# Altium schematic sheet CH32L103-WUI-R1-1v2.SchDoc
size 274 x 287 mm; Symbol: Sheet-Symbol_A4; Company: Caesar; Drawed: Caesar; Reviewed: Caesar; Version: V1.0; Page Size: A4; @Project Name: CH32X035G8U6_Multifunctional_Keyboard-1v3-20240412; @Page Count: 1; @Update Date: 2024-04-12; @Create Date: 2024-03-18; @Schematic Name: Schematic1; @Page No: 1; @Page Name: P1; Device: Sheet-Symbol_A4; SheetNumber: 1; SheetTotal: 1
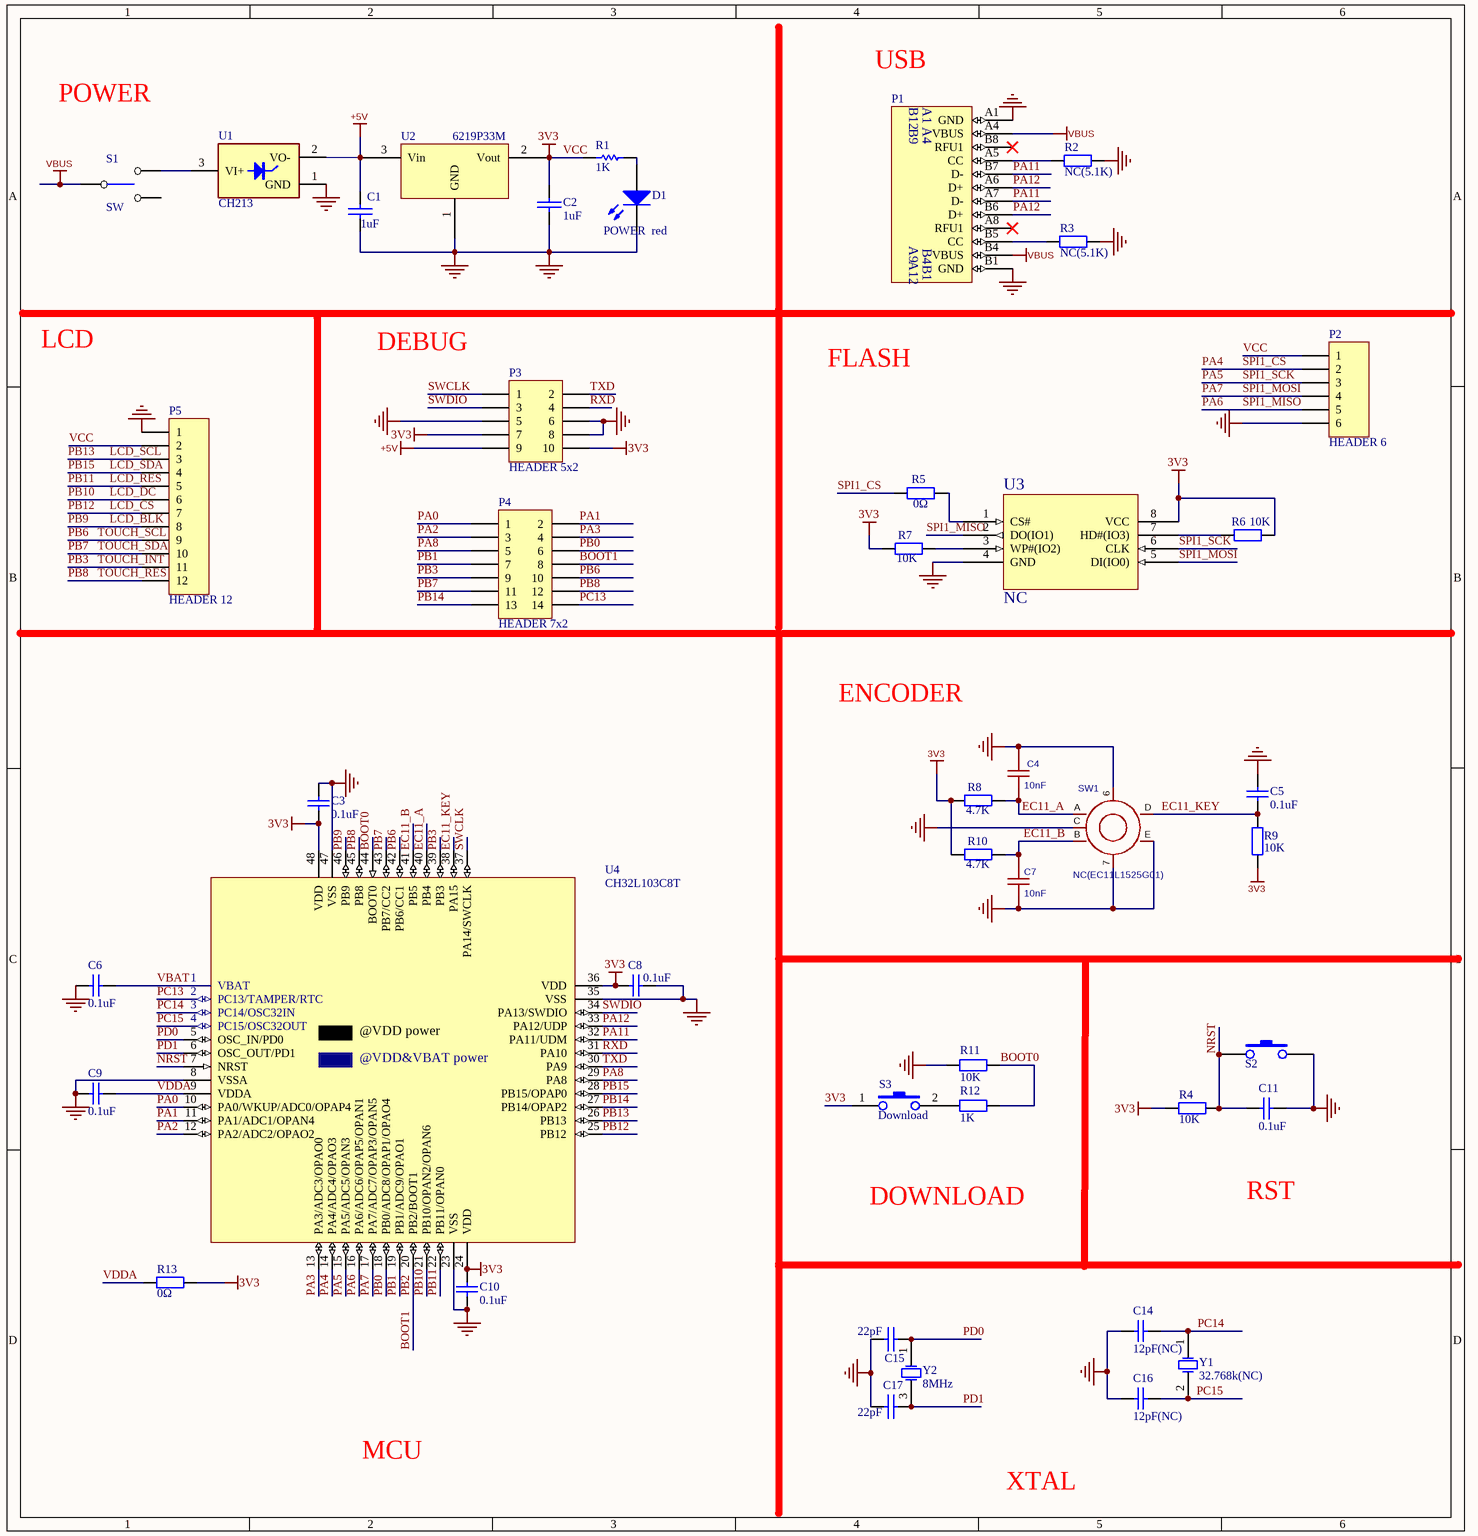
[diagram p0: CH32L103-WUI-R1-1v2.SchDoc]

## Parts
C1  1uF  [0402_C]
C2  1uF  [0402_C]
C3  0.1uF  [0402_C]
C4  10nF  [0402_C]
C5  0.1uF  [0402_C]
C6  0.1uF  [0402_C]
C7  10nF  [0402_C]
C8  0.1uF  [0402_C]
C9  0.1uF  [0402_C]
C10  0.1uF  [0402_C]
C11  0.1uF  [0402_C]
C14  12pF(NC)  [0402_C]
C15  22pF  [0402_C]
C16  12pF(NC)  [0402_C]
C17  22pF  [0402_C]
D1  POWER  red  [0603+]
P1  TYPE-C  [TYPE-C-Receptacle-2.0]  (value not drawn)
P2  HEADER 6  [SIP6-2.54mm]
P3  HEADER 5x2  [IDC10-2.54mm]
P4  HEADER 7x2  [IDC14-2.54mm]
P5  HEADER 12  [SIP12-2.54mm]
R1  1K  [0402]
R2  NC(5.1K)  [0402]
R3  NC(5.1K)  [0402]
R4  10K  [0402]
R5  0Ω  [0402]
R6  10K  [0402]
R7  10K  [0402]
R8  4.7K  [0402]
R9  10K  [0402]
R10  4.7K  [0402]
R11  10K  [0402]
R12  1K  [0402]
R13  0Ω  [0402]
S1  SW  [SW1]
S2  NRST  [贴片按键]  (value not drawn)
S3  Download  [贴片按键]
SW1  NC(EC11L1525G01)  [SW-TH_ALPS_EC11L1525G01]
U1  CH213  [SOT-23-3]
U2  6219P33M  [SOT-23]
U3  NC  [SOIC-8_208mil]
U4  CH32L103C8T  [LQFP48]
Y1  32.768k(NC)  [FC-135]
Y2  8MHz  [XT3225]

## Nets
3V3: C2.1 C3.2 C8.2 C10.2 P2.1 P3.7 P3.10 P5.2 R1.2 R4.2 R6.2 R7.1 R8.1 R9.1 R10.1 R13.1 S3.1 U2.2(Vout) U3.8(VCC) U4.24(VDD) U4.36(VDD) U4.48(VDD)  [also labelled VCC]
+5V: C1.1 P3.9 U1.2(VO-) U2.3(Vin)
GND: C1.2 C2.2 C3.1 C4.2 C5.1 C6.2 C7.2 C8.1 C9.2 C10.1 C11.1 C14.2 C15.1 C16.2 C17.1 D1.2(K) P1.A1(GND) P1.B1(GND) P2.6 P3.5 P3.6 P3.8 P5.1 R2.2 R3.2 R11.2 S2.2 SW1.6(EH) SW1.7(EH) SW1.C SW1.E U1.1(GND) U2.1(GND) U3.4(GND) U4.8(VSSA) U4.23(VSS) U4.35(VSS) U4.47(VSS)
VBUS: P1.A4(VBUS) P1.B4(VBUS) S1.1
BOOT0: R11.1 R12.1 U4.44(BOOT0)
BOOT1: P4.8 U4.20(PB2/BOOT1)  [also labelled PB2]
EC11_A: C4.1 R8.2 SW1.A U4.40(PB4)
EC11_B: C7.1 R10.2 SW1.B U4.41(PB5)
EC11_KEY: C5.2 R9.2 SW1.D U4.38(PA15)
LCD_BLK: P5.8 U4.46(PB9)  [also labelled PB9]
LCD_CS: P5.7 U4.25(PB12)  [also labelled PB12]
LCD_DC: P5.6 U4.21(PB10/OPAN2/OPAN6)  [also labelled PB10]
LCD_RES: P5.5 U4.22(PB11/OPAN0)  [also labelled PB11]
LCD_SCL: P5.3 U4.26(PB13)  [also labelled PB13]
LCD_SDA: P5.4 U4.28(PB15/OPAP0)  [also labelled PB15]
NRST: C11.2 R4.1 S2.1 U4.7(NRST)
PA0: P4.1 U4.10(PA0/WKUP/ADC0/OPAP4)
PA1: P4.2 U4.11(PA1/ADC1/OPAN4)
PA2: P4.3 U4.12(PA2/ADC2/OPAO2)
PA3: P4.4 U4.13(PA3/ADC3/OPAO0)
PA4: P2.2 R5.1 U4.14(PA4/ADC4/OPAO3)  [also labelled SPI1_CS]
PA5: P2.3 U3.6(CLK) U4.15(PA5/ADC5/OPAN3)  [also labelled SPI1_SCK]
PA6: P2.5 U3.2(DO(IO1)) U4.16(PA6/ADC6/OPAP5/OPAN1)  [also labelled SPI1_MISO]
PA7: P2.4 U3.5(DI(IO0)) U4.17(PA7/ADC7/OPAP3/OPAN5)  [also labelled SPI1_MOSI]
PA8: P4.5 U4.29(PA8)
PA11: P1.A7(D-) P1.B7(D-) U4.32(PA11/UDM)
PA12: P1.A6(D+) P1.B6(D+) U4.33(PA12/UDP)
PB0: P4.6 U4.18(PB0/ADC8/OPAP1/OPAO4)
PB1: P4.7 U4.19(PB1/ADC9/OPAO1)
PB3: P4.9 P5.11 U4.39(PB3)  [also labelled TOUCH_INT]
PB6: P4.10 P5.9 U4.42(PB6/CC1)  [also labelled TOUCH_SCL]
PB7: P4.11 P5.10 U4.43(PB7/CC2)  [also labelled TOUCH_SDA]
PB8: P4.12 P5.12 U4.45(PB8)  [also labelled TOUCH_RES]
PB14: P4.13 U4.27(PB14/OPAP2)
PC13: P4.14 U4.2(PC13/TAMPER/RTC)
PC14: C14.1 U4.3(PC14/OSC32IN) Y1.1(OSC1)
PC15: C16.1 U4.4(PC15/OSC32OUT) Y1.2(OSC2)
PD0: C15.2 U4.5(OSC_IN/PD0) Y2.1(OSC1)
PD1: C17.2 U4.6(OSC_OUT/PD1) Y2.3(OSC2)
RXD: P3.4 U4.31(PA10)
SWCLK: P3.1 U4.37(PA14/SWCLK)
SWDIO: P3.3 U4.34(PA13/SWDIO)
TXD: P3.2 U4.30(PA9)
VBAT: C6.1 U4.1(VBAT)
VDDA: C9.1 R13.2 U4.9(VDDA)
NetD1_1: D1.1(A) R1.1
NetP1_A5: P1.A5(CC) R2.1
NetP1_B5: P1.B5(CC) R3.1
NetR5_2: R5.2 U3.1(CS#)
NetR6_1: R6.1 U3.7(HD#(IO3))
NetR7_2: R7.2 U3.3(WP#(IO2))
NetR12_2: R12.2 S3.2
NetS1_3: S1.3 U1.3(VI+)

Not connected (* = marked no-connect by the designer): P1 A8(RFU1)* B8(RFU1)*; S1 2

## Notes on the sheet
- USB
- POWER
- LCD
- DEBUG
- FLASH
- ENCODER
- DOWNLOAD
- RST
- MCU
- XTAL
- 更新日期
- 2024-04-12
- 原理图
- 图页
- Schematic1
- P1
- 创建日期
- 物料编码
- 2024-03-18
- 审阅
- 绘制
- Caesar
- CH32X035G8U6_Multifunctional_Keyboard-1v3-20240412
- 版本
- V1.0
- 尺寸
- A4
- 页
- 1
- 共
- (in symbol CH32L103C8T) @VDD power; @VDD&VBAT power
- (in symbol TYPE-C1) B12; B9; A9; A12

## Library data of the parts
C1 C2 C15 C17 = CAP: Capacitor
C3 C5 C6 C8-C11 C14 C16 = Cap: Capacitor; Published: 8-Jun-2000; LatestRevisionDate: 17-Jul-2002; LatestRevisionNote: Re-released for DXP Platform.; PackageReference: RAD-0.3; Publisher: Altium Limited
  C5 C11: Value: 0.1uF
C4 C7 = CAP_0603: ConvertToPcb: yes; SymbolName: CapAcitance; ModelId: ac125912035d415993ca9572d50418b1; ModelName: C0603_L1.6-W0.8-H0.8; ModelTransform: 62.992,31.496,0,0,0,0,0,0,0; Value: 10nF; Device: CAP_0603; AddInBom: yes; Supplier Footprint: 0603; FootprintName: C0603
D1 = LED0: Typical INFRARED GaAs LED; Published: 8-Jun-2000; LatestRevisionDate: 08-Jul-2005; LatestRevisionNote: Mech Layer 1 removed.; PackageReference: LED-0; Publisher: Altium Limited
P1 = TYPE-C1
P2 = HEADER 6: Header, 6-Pin
P3 = HEADER 5x2: Header, 5-Pin, Dual row
P4 = HEADER 7x2: Header, 7-Pin, Dual row
P5 = HEADER 12: Header, 12-Pin
R1 = Res Semi: Semiconductor Resistor; Published: 8-Jun-2000; LatestRevisionDate: 17-Jul-2002; LatestRevisionNote: Re-released for DXP Platform.; PackageReference: AXIAL-0.5; Publisher: Altium Limited; Value: 1K
R2-R4 R6 R7 R9 R11-R13 = Res2: Resistor
  R4 R6 R7 R9 R11: Published: 8-Jun-2000; LatestRevisionDate: 17-Jul-2002; LatestRevisionNote: Re-released for DXP Platform.; PackageReference: AXIAL-0.4; Publisher: Altium Limited; Value: 10K
  R12 R13: Published: 8-Jun-2000; LatestRevisionDate: 17-Jul-2002; LatestRevisionNote: Re-released for DXP Platform.; PackageReference: AXIAL-0.4; Publisher: Altium Limited
R5 R8 R10 = Res2: Resistor; Value: 10K; Published: 8-Jun-2000; LatestRevisionDate: 17-Jul-2002; LatestRevisionNote: Re-released for DXP Platform.; PackageReference: AXIAL-0.4; Publisher: Altium Limited
S2 = KEY
S3 = KEY1
SW1 = EC11L1525G01: Manufacturer: ALPSALPINE(阿尔卑斯阿尔派); AddInBom: yes; ModelId: cf33b882906a4832899d48957bbfbd3a; ModelTransform: 515.67818,588.582,0,0,0,0,-0.003,0,-137.795; Symbol: EC11L1525G01; Device: EC11L1525G01; LCSC Part Name: EC11L1525G01; SupplierPart: C2991196; ManufacturerPart: EC11L1525G01; Supplier Footprint: 插件; JLCPCB Part Class: 扩展库; Datasheet: https://atta.szlcsc.com/upload/public/pdf/source/20220411/178C78D91D042177C355D008FA29ADBD.pdf; Supplier: LCSC; ConvertToPcb: yes; FootprintName: SW-TH_ALPS_EC11L1525G01; ModelName: SW-TH_ALPS_EC11L1525G01
U1 = CH213E: Ideal Diode 5V*1A
U3 = W25Q32JV
U4 = CH32L103C8T: RISC-V LMD-MCU, 96MHz, USB, Type-C/PD, CAN, OPA, lower power
Y1 Y2 = XTAL: Crystal Oscillator; Published: 8-Jun-2000; LatestRevisionDate: 17-Jul-2002; LatestRevisionNote: Re-released for DXP Platform.; PackageReference: R38; Publisher: Altium Limited
  Y2: PackageDescription: Crystal, Thru-Hole; 2 Leads; Body 3.1 x 8.2 mm (Dia.xH)